# EAGLE design keyboard-controller (EAGLE 9.7.0)
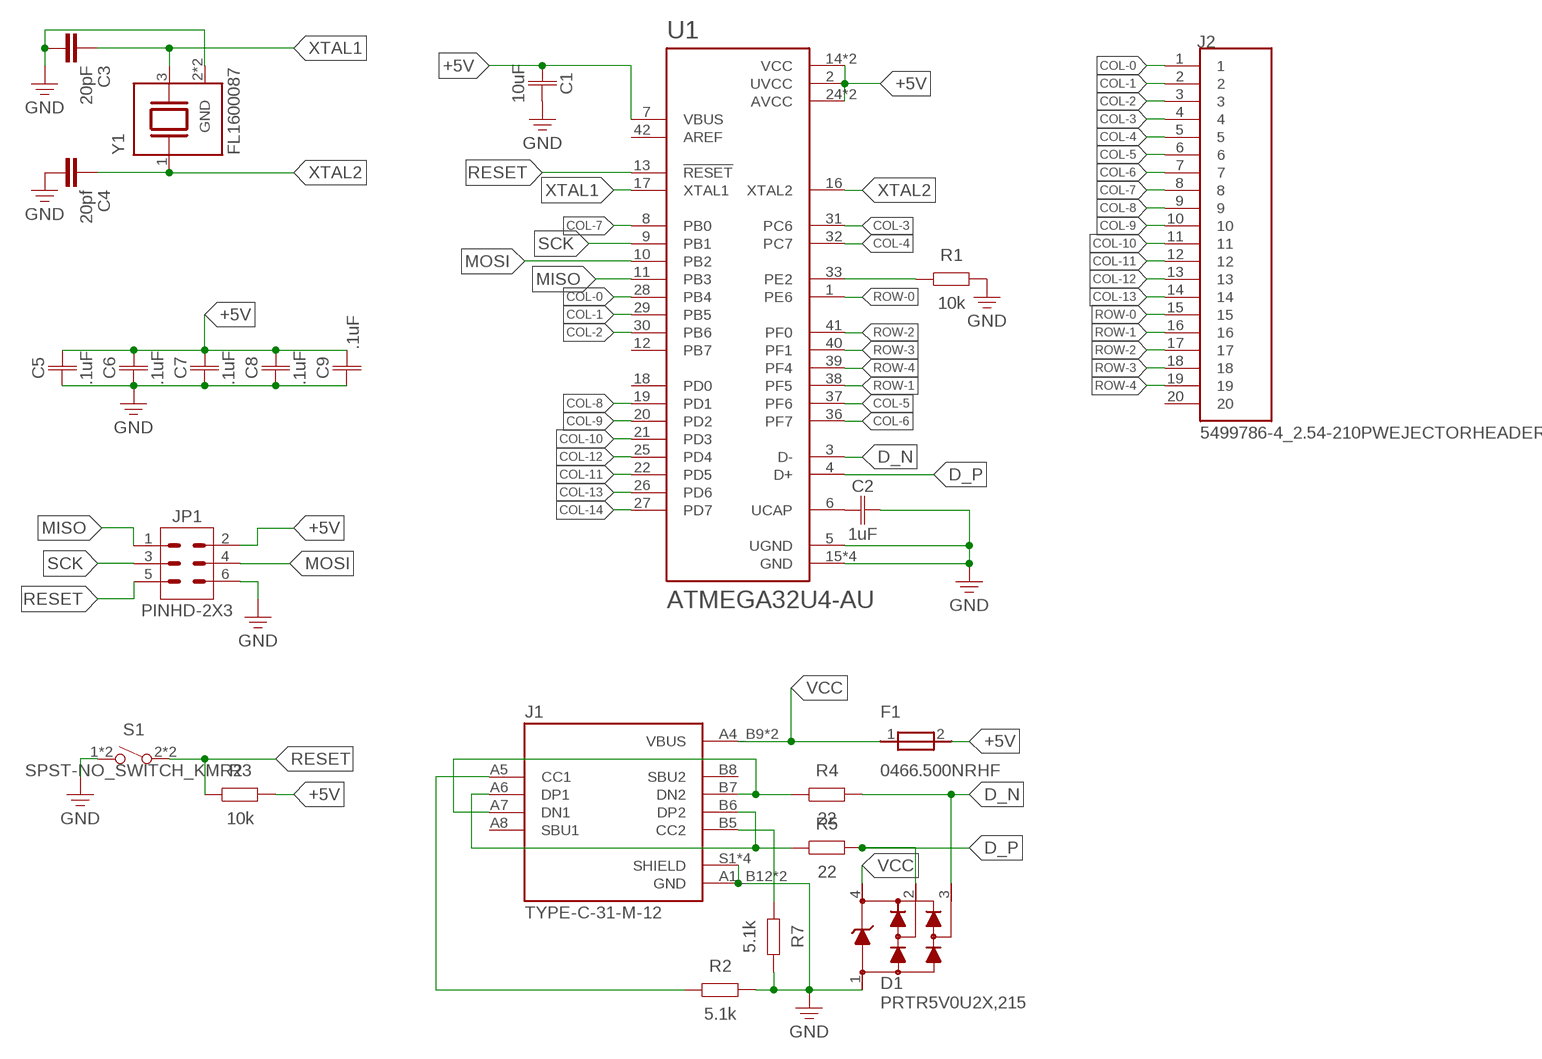
[diagram p0: schematic, sheet 1]

## Parts
C1  10uF  C_CHIP-0402(1005-METRIC)  [CAPC1005X60]
C2  1uF  C_CHIP-0402(1005-METRIC)  [CAPC1005X60]
C3  20pF  C_CHIP-0402(1005-METRIC)  [CAPC1005X60]
C4  20pf  C_CHIP-0402(1005-METRIC)  [CAPC1005X60]
C5  .1uF  C_CHIP-0402(1005-METRIC)  [CAPC1005X60]
C6  .1uF  C_CHIP-0402(1005-METRIC)  [CAPC1005X60]
C7  .1uF  C_CHIP-0402(1005-METRIC)  [CAPC1005X60]
C8  .1uF  C_CHIP-0402(1005-METRIC)  [CAPC1005X60]
C9  .1uF  C_CHIP-0402(1005-METRIC)  [CAPC1005X60]
D1  PRTR5V0U2X,215  [SOT143B]
F1  0466.500NRHF  [FUSC3115X66N]
J1  TYPE-C-31-M-12  [HRO_TYPE-C-31-M-12]
J2  5499786-4_2.54-210PWEJECTORHEADER  [TE_5499786-4]
JP1  PINHD-2X3  [2X03]
R1  10k  R_CHIP-0402(1005-METRIC)  [RESC1005X40]
R2  5.1k  R_CHIP-0402(1005-METRIC)  [RESC1005X40]
R3  10k  R_CHIP-0402(1005-METRIC)  [RESC1005X40]
R4  22  R_CHIP-0402(1005-METRIC)  [RESC1005X40]
R5  22  R_CHIP-0402(1005-METRIC)  [RESC1005X40]
R7  5.1k  R_CHIP-0402(1005-METRIC)  [RESC1005X40]
S1  SPST-NO_SWITCH_KMR2  [KMR2]
U1  ATMEGA32U4-AU  [QFP80P1200X1200X120-44N]
Y1  FL1600087  [XTAL_FL1600087]

## Nets
+5V: C1.1 C5.2 C6.2 C7.2 C8.2 C9.2 F1.2 JP1.2 R3.2 U1.2(UVCC) U1.7(VBUS) U1.14(VCC) U1.24(AVCC) U1.34(VCC) U1.44(AVCC)
CC1: J1.A5(CC1) R2.1
CC2: J1.B5(CC2) R7.1
COL-0: J2.1 U1.28(PB4)
COL-1: J2.2 U1.29(PB5)
COL-2: J2.3 U1.30(PB6)
COL-3: J2.4 U1.31(PC6)
COL-4: J2.5 U1.32(PC7)
COL-5: J2.6 U1.37(PF6)
COL-6: J2.7 U1.36(PF7)
COL-7: J2.8 U1.8(PB0)
COL-8: J2.9 U1.19(PD1)
COL-9: J2.10 U1.20(PD2)
COL-10: J2.11 U1.21(PD3)
COL-11: J2.12 U1.22(PD5)
COL-12: J2.13 U1.25(PD4)
COL-13: J2.14 U1.26(PD6)
COL-14: U1.27(PD7)
D_N: D1.3 R4.2 U1.3(D-)
D_P: D1.2 R5.2 U1.4(D+)
GND: C1.2 C2.2 C3.2 C4.2 C5.1 C6.1 C7.1 C8.1 C9.1 D1.1 J1.A1_B12(GND) J1.B1_A12(GND) J1.S1(SHIELD) J1.S2(SHIELD) J1.S3(SHIELD) J1.S4(SHIELD) JP1.6 R1.2 R2.2 R7.2 S1.1 S1.4 U1.5(UGND) U1.15(GND) U1.23(GND) U1.35(GND) U1.43(GND) Y1.2(GND) Y1.4(GND)
MISO: JP1.1 U1.11(PB3)
MOSI: JP1.4 U1.10(PB2)
N$1: R1.1 U1.33(PE2)
N$2: C2.1 U1.6(UCAP)
N$3: J1.A6(DP1) J1.B6(DP2) R5.1
N$4: J1.A7(DN1) J1.B7(DN2) R4.1
RESET: JP1.5 R3.1 S1.2 S1.3 U1.13(!RESET)
ROW-0: J2.15 U1.1(PE6)
ROW-1: J2.16 U1.38(PF5)
ROW-2: J2.17 U1.41(PF0)
ROW-3: J2.18 U1.40(PF1)
ROW-4: J2.19 U1.39(PF4)
SCK: JP1.3 U1.9(PB1)
VCC: D1.4 F1.1 J1.A4_B9(VBUS) J1.B4_A9(VBUS)
XTAL1: C3.1 U1.17(XTAL1) Y1.3
XTAL2: C4.1 U1.16(XTAL2) Y1.1
Unconnected: J1.A8(SBU1) J1.B8(SBU2) J2.20 U1.12(PB7) U1.18(PD0) U1.42(AREF)

## Library data of the parts
C1 C2 C5-C9 = Capacitor:C: Capacitor - Generic; CATEGORY: Capacitor; PACKAGE_SIZE: 0402; PACKAGE_TYPE: Surface Mount; SUBCATEGORY: Ceramic Capacitors; TYPE: MLCC
C3 C4 = Tutorial - Fusion 360:C: Capacitor - Generic; CATEGORY: Capacitor
D1 = PRTR5V0U2X_215:PRTR5V0U2X,215: Check availability <https://pricing.snapeda.com/parts/PRTR5V0U2X%2C215/Nexperia%20USA/view-part?ref=eda>; AVAILABILITY: In Stock; CHECK_PRICES: https://www.snapeda.com/parts/PRTR5V0U2X,215/Nexperia/view-part/?ref=eda; DESCRIPTION: - Clamp - Ipp Tvs Diode Surface Mount SOT-143B; MF: Nexperia USA; MP: PRTR5V0U2X,215; PACKAGE: SOT143B-4 Nexperia USA Inc.; PRICE: None; SNAPEDA_LINK: https://www.snapeda.com/parts/PRTR5V0U2X,215/Nexperia/view-part/?ref=snap
F1 = FUSC3115X66N:0466.500NRHF: Check availability <https://pricing.snapeda.com/parts/0466.500NRHF/Littelfuse%20Inc./view-part?ref=eda>; AVAILABILITY: In Stock; CHECK_PRICES: https://www.snapeda.com/parts/0466.500NRHF/Littelfuse/view-part/?ref=eda; DESCRIPTION: 470 Series 1206 Fast-Acting Fuse; MF: Littelfuse Inc.; MP: 0466.500NRHF; PACKAGE: 1206 Littelfuse Inc.; PRICE: None; SNAPEDA_LINK: https://www.snapeda.com/parts/0466.500NRHF/Littelfuse/view-part/?ref=snap
J1 = TYPE-C-31-M-12:TYPE-C-31-M-12: Check availability <https://pricing.snapeda.com/parts/TYPE-C-31-M-12/HRO%20Electronics%20Co.%2C%20Ltd./view-part?ref=eda>; AVAILABILITY: Not in stock; CHECK_PRICES: https://www.snapeda.com/parts/TYPE-C-31-M-12/HRO+Electronics+Co.%252C+Ltd./view-part/?ref=eda; DESCRIPTION: USB Connectors 24 Receptacle 1 8.94*7.3mm RoHS; MF: HRO Electronics Co., Ltd.; MP: TYPE-C-31-M-12; PACKAGE: Package; PRICE: None; SNAPEDA_LINK: https://www.snapeda.com/parts/TYPE-C-31-M-12/HRO+Electronics+Co.%252C+Ltd./view-part/?ref=snap
J2 = TE-5499786-4:5499786-4_2.54-2*10PWEJECTORHEADER: Check availability <https://pricing.snapeda.com/parts/5499786-4/TE%20Connectivity/view-part?ref=eda>; AVAILABILITY: In Stock; CHECK_PRICES: https://www.snapeda.com/parts/5499786-4/TE+Connectivity+AMP+Connectors/view-part/?ref=eda; COMMENT: 5499786-4; DESCRIPTION: HEADER, UNIVERSAL EJECTION PIN, AMP-LATCH, 20 POS, 2.54 X 2.54, PCB, RIGHT ANGLE | TE Connectivity 5499786-4; EU_ROHS_COMPLIANCE: Compliant; MF: TE Connectivity; MP: 5499786-4; PACKAGE: None; PRICE: None; SNAPEDA_LINK: https://www.snapeda.com/parts/5499786-4/TE+Connectivity+AMP+Connectors/view-part/?ref=snap
JP1 = JST B2B-XA-A-GU:PINHD-2X3: Pin Header; CATEGORY: Connectors; DESCRIPTION: Header-Straight-2x3 Position; PACKAGE_TYPE: Through Hole; PITCH: 0.100" (2.54mm); SUBCATEGORY: Headers; TYPE: Male Pins
R1-R5 R7 = Resistor:R: Resistor Fixed - Generic; CATEGORY: Resistors; DESCRIPTION: Chip Resistor 1.05 X 0.54 X 0.40 mm body 0402(1005-METRIC) Package; PACKAGE_SIZE: 0402; PACKAGE_TYPE: Surface Mount
S1 = Switch:SPST-NO_SWITCH: SPST Switches with NO Configuration; CATEGORY: Switches; DATASHEET: https://www.ckswitches.com/media/1479/kmr2.pdf; DESCRIPTION: Tactile Switch SPST-NO Top Actuated Surface Mount; MANUFACTURER: C&K; MPN: KMR211G LFS; OPERATING_TEMPERATURE: -40°C ~ 85°C; PACKAGE_SIZE: NA; PACKAGE_TYPE: Surface Mount; PART_STATUS: Active; ROHS: Compliant; SERIES: KMR2; SUBCATEGORY: Tactile Switches; TYPE: SPST-NO
U1 = ATMEGA32U4-AU:ATMEGA32U4-AU: Check availability <https://pricing.snapeda.com/parts/ATMEGA32U4-AU/Microchip%20Technology%20/%20Atmel/view-part?ref=eda>; AVAILABILITY: In Stock; CHECK_PRICES: https://www.snapeda.com/parts/ATMEGA32U4-AU/Microchip/view-part/?ref=eda; DESCRIPTION: AVR AVR® ATmega Microcontroller IC 8-Bit 16MHz 32KB (16K x 16) FLASH 44-TQFP (10x10); MF: Microchip Technology / Atmel; MP: ATMEGA32U4-AU; PACKAGE: TQFP-44 Microchip; PRICE: None; SNAPEDA_LINK: https://www.snapeda.com/parts/ATMEGA32U4-AU/Microchip/view-part/?ref=snap
Y1 = XTAL FL1600087:FL1600087: Check availability <https://pricing.snapeda.com/parts/FL1600087/Diodes%20Incorporated/view-part?ref=eda>; AVAILABILITY: In Stock; CHECK_PRICES: https://www.snapeda.com/parts/FL1600087/Diodes+Inc./view-part/?ref=eda; DESCRIPTION: Crystal 16MHz ±15ppm (Tol) ±15ppm (Stability) 20pF FUND 28.9Ohm 4-Pin SMD; MF: Diodes Incorporated; MP: FL1600087; PACKAGE: NON STANDARD-4 Diodes Inc.; PRICE: None; SNAPEDA_LINK: https://www.snapeda.com/parts/FL1600087/Diodes+Inc./view-part/?ref=snap

## Board
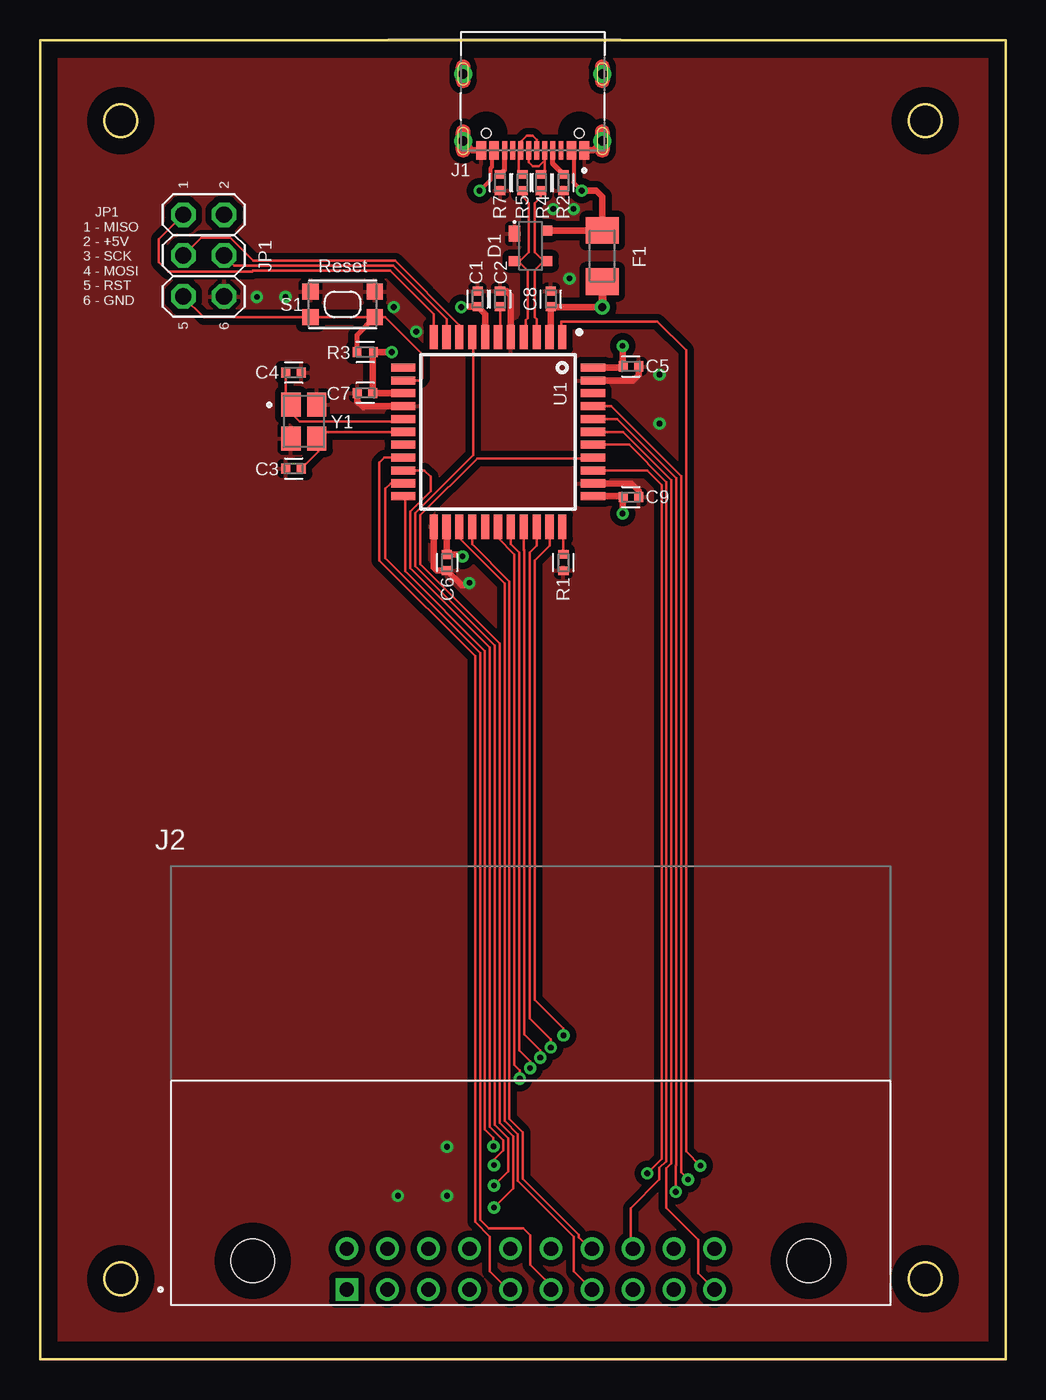
[diagram p1: board, top side]
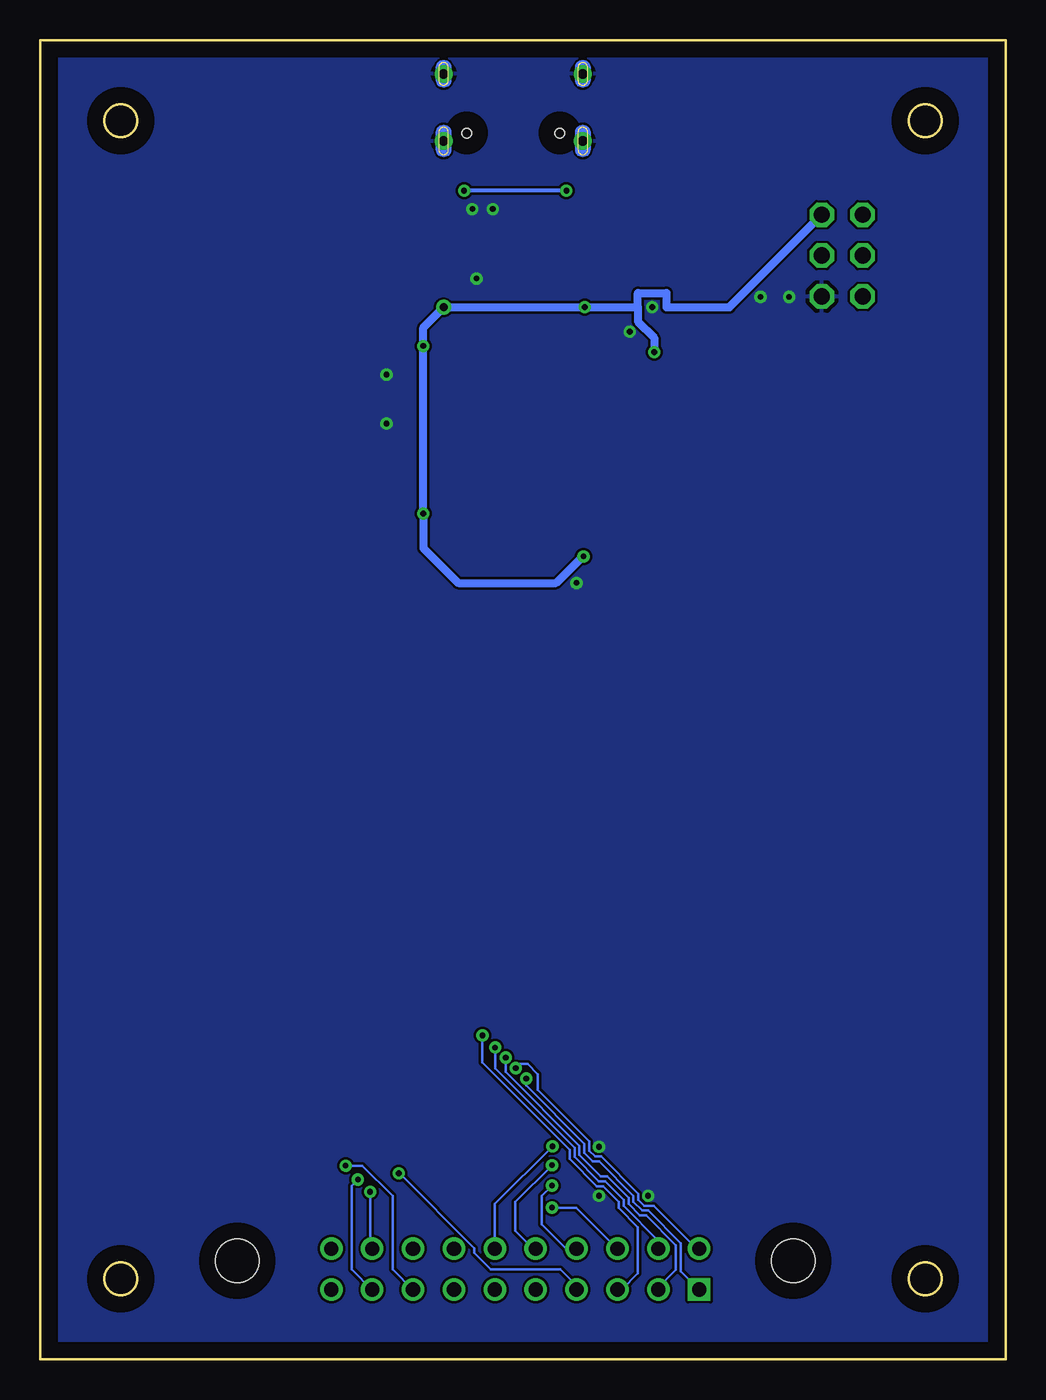
[diagram p2: board, bottom side, seen from below]

Size 60 x 82 mm. Coordinates in mm from the lower left corner, seen from the top.
Outline: 0,82 60,82 60,0 0,0 0,82
Outline: circle at 5,5 radius 1
Outline: circle at 55,5 radius 1
Outline: circle at 5,77 radius 1
Outline: circle at 55,77 radius 1
Copper layers (1*16): Top 0.035mm / dielectric 1.5mm / Bottom 0.035mm
Design rules "Fusion Electronics Design Rules": minimum track width 6mil, minimum drill 0.35mm, track to track 6mil, track to pad 6mil, pad to pad 6mil, via to via 6mil, smd to smd 6mil, copper to edge 40mil, drill to drill 6mil, minimum pad ring 10mil, minimum via ring 8mil, stop-mask expansion 4mil, vias tented up to drill 9999mil, thermal gap 10mil

### Footprints (pad centres in the part's own frame; a part is rotated, then mirrored left to right if it is on the bottom)
CAPC1005X60 = smd 0.56 x 0.629: 1 -0.485,0; 2 0.485,0
SOT143B = smd 1 x 0.7: 1 -0.75,-1 | smd 0.6 x 0.7: 2 0.95,-1; 3 0.95,1; 4 -0.95,1
FUSC3115X66N = smd 1.65 x 2.03: 1 -1.59,0; 2 1.59,0
HRO_TYPE-C-31-M-12 = smd 0.6 x 1.14: A1_B12 -3.2,4.75; A4_B9 -2.4,4.75; B1_A12 3.2,4.75; B4_A9 2.4,4.75 | smd 0.3 x 1.14: A5 -1.25,4.75; A6 -0.25,4.75; A7 0.25,4.75; A8 1.25,4.75; B5 1.75,4.75; B6 0.75,4.75; B7 -0.75,4.75; B8 -1.75,4.75 | drill 0.6 pad 0.9: S1 -4.325,4.17; S2 4.325,4.17; S3 -4.325,0; S4 4.325,0 | hole 0.6: -2.89,3.68; 2.89,3.68
TE_5499786-4 = drill 0.89 pad 1.24 square: 1 0,0 | drill 0.89 pad 1.24: 2 0,2.54; 3 2.54,0; 4 2.54,2.54; 5 5.08,0; 6 5.08,2.54; 7 7.62,0; 8 7.62,2.54; 9 10.16,0; 10 10.16,2.54; 11 12.7,0; 12 12.7,2.54; 13 15.24,0; 14 15.24,2.54; 15 17.78,0; 16 17.78,2.54; 17 20.32,0; 18 20.32,2.54; 19 22.86,0; 20 22.86,2.54 | hole 2.69: -5.84,1.8; 28.7,1.8
2X03 = drill 1.016 octagon: 1 -2.54,-1.27; 2 -2.54,1.27; 3 0,-1.27; 4 0,1.27; 5 2.54,-1.27; 6 2.54,1.27
RESC1005X40 = smd 0.535 x 0.644: 1 -0.507,0; 2 0.507,0
KMR2 = smd 1 x 1: 1 2,0.8; 2 2,-0.8; 3 -2,-0.8; 4 -2,0.8
QFP80P1200X1200X120-44N = smd 1.5 x 0.5: 1 -5.9,4; 2 -5.9,3.2; 3 -5.9,2.4; 4 -5.9,1.6; 5 -5.9,0.8; 6 -5.9,0; 7 -5.9,-0.8; 8 -5.9,-1.6; 9 -5.9,-2.4; 10 -5.9,-3.2; 11 -5.9,-4; 23 5.9,-4; 24 5.9,-3.2; 25 5.9,-2.4; 26 5.9,-1.6; 27 5.9,-0.8; 28 5.9,0; 29 5.9,0.8; 30 5.9,1.6; 31 5.9,2.4; 32 5.9,3.2; 33 5.9,4 | smd 0.5 x 1.5: 12 -4,-5.9; 13 -3.2,-5.9; 14 -2.4,-5.9; 15 -1.6,-5.9; 16 -0.8,-5.9; 17 0,-5.9; 18 0.8,-5.9; 19 1.6,-5.9; 20 2.4,-5.9; 21 3.2,-5.9; 22 4,-5.9; 34 4,5.9; 35 3.2,5.9; 36 2.4,5.9; 37 1.6,5.9; 38 0.8,5.9; 39 0,5.9; 40 -0.8,5.9; 41 -1.6,5.9; 42 -2.4,5.9; 43 -3.2,5.9; 44 -4,5.9
XTAL_FL1600087 = smd 1.2 x 1.5: 1 -0.8,1.05; 2 -0.8,-1.05; 3 0.8,-1.05; 4 0.8,1.05

### Placement (x,y rotation side)
C1  27.18,65.91 90 top
C2  28.57,65.91 90 top
C3  15.75,55.37 180 top
C4  15.75,61.34 0 top
C5  36.7,61.72 180 top
C6  25.27,49.53 90 top
C7  20.19,60.07 0 top
C8  31.73,65.91 270 top
C9  36.7,53.59 180 top
D1  30.48,69.22 270 top
F1  34.92,68.58 270 top
J1  30.61,79.91 180 top
J2  19.05,4.33 0 top
JP1  10.16,68.61 270 top
R1  32.51,49.53 270 top
R2  32.51,73.15 270 top
R3  20.19,62.61 0 top
R4  31.11,73.15 270 top
R5  29.97,73.15 270 top
R7  28.57,73.15 270 top
S1  18.8,65.58 0 top
U1  28.45,57.65 270 top
Y1  16.38,58.29 0 top

### Tracks (layer width: path | path; a pad name or v marks a point on that pad's centre or on a via)
+5V  (via drill 0.35, 0.5)
  Top 0.152: C5.2 36.15,61.65 | C9.2 36.16,53.65 | 25.27,51.73 U1.24 | 31.73,63.64 U1.2
  Top 0.305: 31.75,65.41 C8.2 | 36.2,61.74 C5.2
  Top 0.406: 36.15,61.65 U1.44 | v36.2,62.99 36.2,61.74 | U1.14 22.53,60.07 C7.2 20.68,62.59 R3.2 v21.84,62.61 | U1.24 25.27,51.73 C6.2 26.14,50.02 v26.24,49.91 | v26.16,65.41 26.18,65.43 C1.1 27.65,64.96 U1.7 | v34.92,65.41 31.75,65.41 | C8.2 31.73,63.64 | 31.73,63.64 | U1.34 36.16,53.65 C9.2 36.2,53.57 v36.2,52.58
  Top 0.508: F1.2 v34.92,65.41
  Bottom 0.508: 22.86,65.41 v26.16,65.41 v34.92,65.41 36.2,64.14 v36.2,62.99 v36.2,52.58 36.2,50.42 34.04,48.26 27.94,48.26 26.29,49.91 v26.24,49.91 | JP1.2 17.18,65.41 21.09,65.41 21.09,66.29 22.86,66.29 22.86,65.41 | 22.86,65.41 22.86,65.4 22.86,64.52 21.84,63.51 v21.84,62.61
CC1
  Top 0.305: R2.1 31.86,74.31 J1.A5
CC2
  Top 0.305: R7.1 28.86,73.94 J1.B5
COL-0  (via drill 0.35)
  Top 0.152: U1.28 28.45,51.05 29.46,50.04 29.46,18.29 29.8,17.96 v29.8,17.45
  Bottom 0.152: J2.1 20.19,5.47 20.19,7.22 22.22,9.25 22.6,9.25 23.14,9.78 23.14,10.18 25.26,12.3 25.65,12.3 26.18,12.83 26.18,13.41 29.8,17.02 v29.8,17.45
COL-1  (via drill 0.35)
  Top 0.152: U1.29 29.25,50.69 29.77,50.16 29.77,19.19 30.44,18.52 v30.44,18.1 v30.45,18.1
  Bottom 0.152: v30.45,18.1 30.19,18.35 29.71,18.35 29.08,17.72 29.08,16.76 25.88,13.56 25.88,12.96 25.52,12.6 25.13,12.6 22.83,10.3 22.83,9.91 22.48,9.55 21.87,9.55 19.19,6.87 J2.2
COL-2  (via drill 0.35)
  Top 0.152: v31.07,18.75 v31.07,18.76 31.07,19.21 30.07,20.21 30.07,50.29 30.05,50.32 U1.30
  Bottom 0.152: v31.07,18.75 31.07,17.86 26.49,13.28 26.49,12.7 25.16,11.38 24.77,11.38 23.44,10.05 23.44,9.66 22.73,8.94 22.35,8.94 20.5,7.09 20.5,5.55 21.72,4.33 21.72,4.2 J2.3
COL-3  (via drill 0.35)
  Top 0.152: U1.31 30.85,50.58 30.43,50.16 30.43,21.18 31.72,19.89 v31.72,19.39 v31.73,19.39
  Bottom 0.152: v31.73,19.39 v31.72,19.38 31.72,18.08 26.79,13.15 26.79,12.58 25.29,11.07 24.89,11.07 23.75,9.92 23.75,9.53 21.59,7.37 J2.4
COL-4  (via drill 0.35)
  Top 0.152: U1.32 31.65,50.57 30.73,49.66 30.73,22.35 32.52,20.57 v32.52,20.13
  Bottom 0.152: J2.5 23.86,4.33 22.86,5.33 22.86,8.21 24.05,9.4 24.05,9.8 25.02,10.77 25.41,10.77 27.1,12.45 27.1,13.03 32.52,18.45 v32.52,20.13
COL-5  (via drill 0.35)
  Top 0.152: U1.37 34.3,56.01 27.15,56.01 23.62,52.48 23.62,49.43 28.55,44.5 28.55,14.69 29.38,13.86 29.38,10.61 v28.19,9.43
  Bottom 0.152: v28.19,9.43 26.68,9.43 J2.6
COL-6  (via drill 0.35)
  Top 0.152: U1.36 37.71,55.25 38.61,54.36 38.61,12.45 v37.72,11.56
  Bottom 0.152: J2.7 26.67,4.57 27.69,5.59 32,5.59 33.02,6.6 33.02,6.91 37.66,11.56 v37.72,11.56
COL-7  (via drill 0.35)
  Top 0.152: U1.8 26.92,63.48 26.92,56.21 23.32,52.6 23.32,49.3 28.25,44.37 28.25,14.56 29.08,13.73 29.08,11.68 v28.19,10.79
  Bottom 0.152: v28.19,10.79 28.83,10.16 28.83,8.38 27.32,6.87 J2.8
COL-8
  Top 0.152: U1.19 21.38,56.05 21.08,55.75 21.08,49.66 27.03,43.71 27.03,8.53 27.94,7.62 27.94,5.46 29.07,4.33 J2.9
COL-9  (via drill 0.35)
  Top 0.152: U1.20 23.87,55.25 24.26,54.86 24.26,53.98 22.99,52.7 22.99,49.2 27.94,44.25 27.94,14.44 28.77,13.6 28.77,12.99 28.19,12.41 v28.19,12.06
  Bottom 0.152: v28.19,12.06 30.48,9.78 30.48,8 29.35,6.87 J2.10
COL-10
  Top 0.152: J2.11 31.75,4.57 30.44,5.88 30.44,7.7 30.01,8.13 27.87,8.13 27.33,8.67 27.33,43.92 21.44,49.8 21.44,54.12 21.77,54.45 U1.21
COL-11  (via drill 0.35)
  Top 0.152: U1.22 22.68,53.53 22.68,49 27.64,44.04 27.64,14.31 28.16,13.78 v28.16,13.24
  Bottom 0.152: J2.12 31.75,9.65 v28.16,13.24
COL-12
  Top 0.152: U1.25 26.05,51.04 28.85,48.23 28.85,14.81 29.69,13.98 29.69,11.08 33.15,7.62 33.15,5.47 J2.13
COL-13
  Top 0.152: U1.26 26.85,50.67 29.16,48.36 29.16,14.94 29.99,14.11 29.99,11.21 33.45,7.75 33.45,7.58 34.16,6.87 J2.14
D_N
  Top 0.152: R4.2 31.11,72.26 30.73,71.88 30.73,68.83 31.3,68.27 | 30.73,63.67 U1.3 30.85,64.66 30.73,64.77 30.73,67.7 31.3,68.27 | 31.61,68.01 31.61,68.14 D1.3 31.3,68.27
D_P
  Top 0.152: R5.2 29.97,72.26 30.35,71.88 30.35,68.83 29.78,68.27 29.72,68.27 | 29.72,68.27 30.3,67.68 30.3,64.72 30.18,64.59 30.18,63.68 U1.4 | D1.2 29.72,68.27
GND  (via drill 0.35)
  Top 0.152: 15.26,56.92 Y1.2
  Top 0.406: U1.43 36.3,60.85 36.32,60.83 36.83,60.83 37.19,61.19 C5.1 | J1.A1_B12 34.35,75.16 J1.S1 | J1.B1_A12 26.86,75.16 J1.S2 | U1.23 24.45,49.21 24.64,49.02 25.25,49.02 C6.1 26.16,48.16 26.16,48.13 26.54,48.13 v26.67,48.26 | U1.35 36.73,54.45 37.19,54 C9.1 | U1.5 29.25,66.13 28.98,66.4 C2.2 | U1.15 20.14,59.25 20.07,59.18 19.71,59.54 C7.1
  other vias: 15.24,66.04 13.46,66.04 21.97,65.41 23.37,63.88 38.48,61.21 38.48,58.17 31.88,71.5 33.15,71.5 32.89,67.18 25.27,13.21 25.27,10.16 22.23,10.16
  pour Bottom: -1.19,-1.19 60.88,-1.19 60.88,82.47 -1.19,82.47
  pour Top (isolate 0.406): 13.54,53.92 18.97,53.92 18.97,62.66 13.54,62.66
  pour Top (isolate 0.406): -1.19,-1.19 60.88,-1.19 60.88,82.47 -1.19,82.47
MISO
  Top 0.152: U1.11 24.45,64.96 21.74,67.67 13.21,67.67 13.16,67.62 7.94,67.62 7.37,68.2 7.37,69.63 JP1.1
MOSI
  Top 0.152: U1.10 25.25,64.67 21.94,67.98 12.07,67.98 JP1.4
N$1
  Top 0.152: R1.1 32.51,51.69 U1.33
N$2
  Top 0.152: C2.1 28.57,63.68 U1.6
N$3
  Top 0.152: J1.A6 30.86,75.82 30.61,76.07 30.23,76.07 29.86,75.7 J1.B6 29.74,75.03 29.74,73.9 R5.1
N$4
  Top 0.152: J1.A7 30.36,74.42 30.61,74.17 30.99,74.17 31.36,74.54 J1.B7 31.36,73.9 R4.1
RESET
  Top 0.152: JP1.5 8.89,66.04 10.16,64.77 16.79,64.77 S1.3 S1.2 21.45,64.78 23.75,62.48 23.75,61 23.6,60.85 U1.13
  Top 0.305: R3.1 19.69,63.67 S1.2
ROW-0  (via drill 0.35)
  Top 0.152: U1.1 32.38,63.62 32.38,64.52 38.35,64.52 40.13,62.74 40.13,12.92 v41.02,12.03
  Bottom 0.152: v41.02,12.03 39.97,12.03 38.1,10.16 38.1,5.59 36.84,4.33 J2.15
ROW-1
  Top 0.152: 34.41,56.79 U1.38 36.6,56.85 38.91,54.54 38.91,12.32 38.48,11.89 38.48,11.18 36.7,9.4 36.7,7 J2.16
ROW-2  (via drill 0.35)
  Top 0.152: U1.41 35.49,59.25 39.83,54.91 39.83,11.61 v40.26,11.18
  Bottom 0.152: v40.26,11.18 40.64,10.79 40.64,5.59 39.38,4.33 J2.17
ROW-3  (via drill 0.35)
  Top 0.152: U1.40 35.86,58.45 39.52,54.79 39.52,12.07 39.5,12.04 v39.5,10.41
  Bottom 0.152: v39.5,10.41 39.5,7 J2.18
ROW-4
  Top 0.152: 42.18,4.33 J2.19 41.9,4.33 40.89,5.33 40.89,7.42 38.89,9.42 38.89,11.87 39.22,12.19 39.22,54.66 36.23,57.65 U1.39
SCK
  Top 0.152: JP1.3 10,69.72 11.81,69.72 13.25,68.28 22.07,68.28 26.05,64.3 U1.9
VCC  (via drill 0.35)
  Top 0.254: J1.A4_B9 33.15,75.02 33.15,73.15 v33.66,72.64 | v27.3,72.64 27.97,73.31 27.97,74.04 28.07,74.14 28.07,74.68 J1.B4_A9
  Top 0.406: v33.66,72.64 34.54,72.64 34.92,72.26 F1.1 D1.4
  Bottom 0.254: v27.3,72.64 v33.66,72.64
XTAL1
  Top 0.152: C3.1 17.28,56.41 17.28,57.15 Y1.3 17.59,57.65 U1.17
XTAL2
  Top 0.152: C4.1 15.26,59.66 Y1.1 15.58,58.84 16.13,58.29 22.39,58.29 U1.16

### Text on the board
tNames: 1 | 2 | Reset | JP1 / 1 - MISO / 2 - +5V / 3 - SCK / 4 - MOSI / 5 - RST / 6 - GND | 5 | 6